# Altium schematic sheet MOTOR_DRIVER.SchDoc
size A4; SheetNumber: 5; SheetTotal: 5
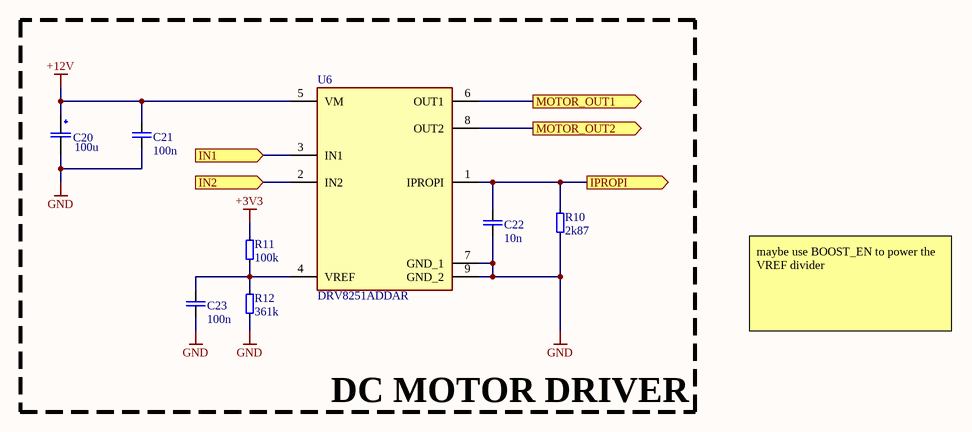
[diagram p0: MOTOR_DRIVER.SchDoc]

## Parts
C20  100u  [CAPAE660X800N]
C21  100n  [C0402]
C22  10n  [C0402]
C23  100n  [C0402]
R10  2k87  [R0402]
R11  100k  [R0402]
R12  361k  [R0402]
U6  DRV8251ADDAR  [SOIC127P600X170-9N]

## Blocks framed on the sheet
DC MOTOR DRIVER: C20-C23 R10-R12 U6

## Ports
IN1 (in), IN2 (in), IPROPI (out), MOTOR_OUT1 (out), MOTOR_OUT2 (out)

## Nets
+3V3: R11.2
+12V: C20.1 C21.2 U6.5(VM)
GND: C20.2 C21.1 C22.1 C23.1 R10.1 R12.1 U6.7(GND_1) U6.9(GND_2)
IN1: U6.3(IN1) ; port IN1
IN2: U6.2(IN2) ; port IN2
IPROPI: C22.2 R10.2 U6.1(IPROPI) ; port IPROPI
MOTOR_OUT1: U6.6(OUT1) ; port MOTOR_OUT1
MOTOR_OUT2: U6.8(OUT2) ; port MOTOR_OUT2
NetC23_2: C23.2 R11.1 R12.2 U6.4(VREF)

## Notes on the sheet
- maybe use BOOST_EN to power the VREF divider

## Library data of the parts
C20 = EDK107M025A9HAA: Surface Mount, Aluminum Electrolytic; Manufacturer_Name: Yageo Group; Geometry.Height: 8mm; Mouser Part Number: 80-EDK107M025A9HAA; Mouser Price/Stock: https://www.mouser.co.uk/ProductDetail/KEMET/EDK107M025A9HAA?qs=T9vdlufmP8yf8os%252BKCOQGA%3D%3D; Manufacturer_Part_Number: EDK107M025A9HAA; Datasheet Link: https://www.yageogroup.com/content/datasheet/asset/file/KEM_A4001_EDK
C21-C23 = CMP-00023-15: Generic SMD 0402 Ceramic Capacitor
R10-R12 = CMP-00016-11: Generic 0402 SMD Resistor
U6 = DRV8251ADDAR: Motor Drives 48-V, 3.5-A H bridge motor driver with current regulation and current sense feedback; Manufacturer_Name: Texas Instruments; Geometry.Height: 1.7mm; Mouser Part Number: 595-DRV8251ADDAR; Mouser Price/Stock: https://www.mouser.co.uk/ProductDetail/Texas-Instruments/DRV8251ADDAR?qs=MyNHzdoqoQKQYZTe%252B1jFCw%3D%3D; Manufacturer_Part_Number: DRV8251ADDAR; Datasheet Link: https://www.arrow.com/en/products/drv8251addar/texas-instruments?region=nac